# Altium schematic sheet High-currenr LEDs.SchDoc
size A; SheetNumber: 6; SheetTotal: 6
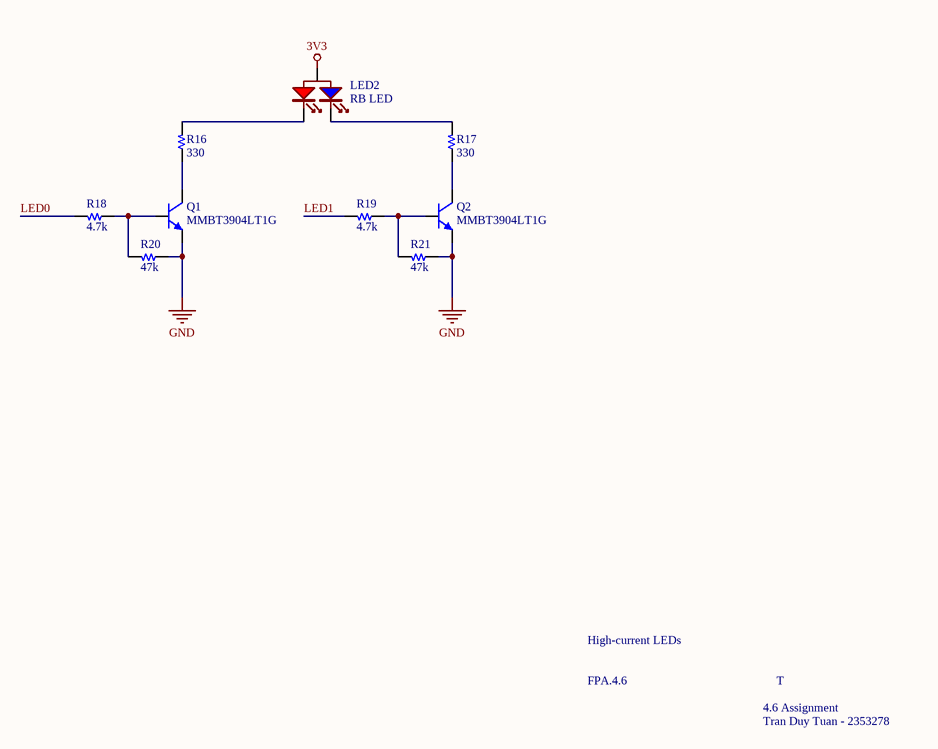
[diagram p0: High-currenr LEDs.SchDoc]

## Parts
LED2  RB LED  [LED-BICOLOR-3MM]
Q1  MMBT3904LT1G  [TO-92/W100]
Q2  MMBT3904LT1G  [TO-92/W100]
R16  330  [R 0805]
R17  330  [R 0805]
R18  4.7k  [R 0805]
R19  4.7k  [R 0805]
R20  47k  [R 0805]
R21  47k  [R 0805]

## Nets
3V3: LED2.2(A)
GND: Q1.2(E) Q2.2(E) R20.1 R21.1
LED0: R18.2
LED1: R19.2
NetLED2_1: LED2.1(K1) R16.2
NetLED2_3: LED2.3(K2) R17.2
NetQ1_1: Q1.1(B) R18.1 R20.2
NetQ1_3: Q1.3(C) R16.1
NetQ2_1: Q2.1(B) R19.1 R21.2
NetQ2_3: Q2.3(C) R17.1

## Notes on the sheet
- High-current LEDs
- FPA.4.6
- 4.6 Assignment
- T
- Tran Duy Tuan - 2353278

## Library data of the parts
LED2 = LED 2-color-A: Bicolor RB 3mm LED
Q1 Q2 = Transistor NPN: NPN Bipolar Transistor; pin to pad: 1>3 2>1 3>2
R16-R21 = Resistor